# Altium schematic sheet 10_J4_CONN.SchDoc
size 420 x 297 mm; SheetNumber: 10; SheetTotal: 10
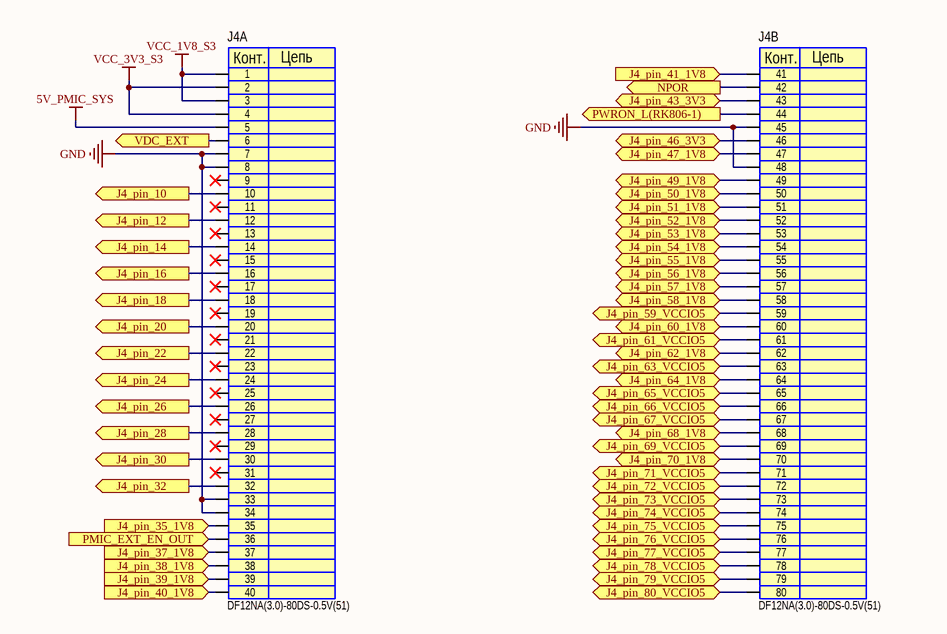
[diagram p0: 10_J4_CONN.SchDoc]

## Parts
J4  DF12NA(3.0)-80DS-0.5V(51)  [CONN_DF12NA3.0-80DS-0.5V51_HIR]  (parts A,B of 2)

## Ports
J4_pin_10 (out), J4_pin_12 (out), J4_pin_14 (out), J4_pin_16 (out), J4_pin_18 (out), J4_pin_20 (out), J4_pin_22 (out), J4_pin_24 (out), J4_pin_26 (out), J4_pin_28 (out), J4_pin_30 (out), J4_pin_32 (out), J4_pin_35_1V8 (in), J4_pin_37_1V8 (in), J4_pin_38_1V8 (in), J4_pin_39_1V8 (in), J4_pin_40_1V8 (in), J4_pin_41_1V8 (in), J4_pin_43_3V3 (bidir), J4_pin_46_3V3 (bidir), J4_pin_47_1V8 (bidir), J4_pin_49_1V8 (bidir), J4_pin_50_1V8 (bidir), J4_pin_51_1V8 (bidir), J4_pin_52_1V8 (bidir), J4_pin_53_1V8 (bidir), J4_pin_54_1V8 (bidir), J4_pin_55_1V8 (bidir), J4_pin_56_1V8 (bidir), J4_pin_57_1V8 (bidir), J4_pin_58_1V8 (bidir), J4_pin_59_VCCIO5 (bidir), J4_pin_60_1V8 (bidir), J4_pin_61_VCCIO5 (bidir), J4_pin_62_1V8 (bidir), J4_pin_63_VCCIO5 (bidir), J4_pin_64_1V8 (bidir), J4_pin_65_VCCIO5 (bidir), J4_pin_66_VCCIO5 (bidir), J4_pin_67_VCCIO5 (bidir), J4_pin_68_1V8 (bidir), J4_pin_69_VCCIO5 (bidir), J4_pin_70_1V8 (bidir), J4_pin_71_VCCIO5 (bidir), J4_pin_72_VCCIO5 (bidir), J4_pin_73_VCCIO5 (bidir), J4_pin_74_VCCIO5 (bidir), J4_pin_75_VCCIO5 (bidir), J4_pin_76_VCCIO5 (bidir), J4_pin_77_VCCIO5 (bidir), J4_pin_78_VCCIO5 (bidir), J4_pin_79_VCCIO5 (bidir), J4_pin_80_VCCIO5 (bidir), NPOR (out), PMIC_EXT_EN_OUT (in), PWRON_L(RK806-1) (out), VDC_EXT (out)

## Nets
5V_PMIC_SYS: J4.5
GND: J4.7 J4.8 J4.33 J4.34 J4.45 J4.48
VCC_1V8_S3: J4.1 J4.3
VCC_3V3_S3: J4.2 J4.4
J4_pin_10: J4.10 ; port J4_pin_10
J4_pin_12: J4.12 ; port J4_pin_12
J4_pin_14: J4.14 ; port J4_pin_14
J4_pin_16: J4.16 ; port J4_pin_16
J4_pin_18: J4.18 ; port J4_pin_18
J4_pin_20: J4.20 ; port J4_pin_20
J4_pin_22: J4.22 ; port J4_pin_22
J4_pin_24: J4.24 ; port J4_pin_24
J4_pin_26: J4.26 ; port J4_pin_26
J4_pin_28: J4.28 ; port J4_pin_28
J4_pin_30: J4.30 ; port J4_pin_30
J4_pin_32: J4.32 ; port J4_pin_32
J4_pin_35_1V8: J4.35 ; port J4_pin_35_1V8
J4_pin_37_1V8: J4.37 ; port J4_pin_37_1V8
J4_pin_38_1V8: J4.38 ; port J4_pin_38_1V8
J4_pin_39_1V8: J4.39 ; port J4_pin_39_1V8
J4_pin_40_1V8: J4.40 ; port J4_pin_40_1V8
J4_pin_41_1V8: J4.41 ; port J4_pin_41_1V8
J4_pin_43_3V3: J4.43 ; port J4_pin_43_3V3
J4_pin_46_3V3: J4.46 ; port J4_pin_46_3V3
J4_pin_47_1V8: J4.47 ; port J4_pin_47_1V8
J4_pin_49_1V8: J4.49 ; port J4_pin_49_1V8
J4_pin_50_1V8: J4.50 ; port J4_pin_50_1V8
J4_pin_51_1V8: J4.51 ; port J4_pin_51_1V8
J4_pin_52_1V8: J4.52 ; port J4_pin_52_1V8
J4_pin_53_1V8: J4.53 ; port J4_pin_53_1V8
J4_pin_54_1V8: J4.54 ; port J4_pin_54_1V8
J4_pin_55_1V8: J4.55 ; port J4_pin_55_1V8
J4_pin_56_1V8: J4.56 ; port J4_pin_56_1V8
J4_pin_57_1V8: J4.57 ; port J4_pin_57_1V8
J4_pin_58_1V8: J4.58 ; port J4_pin_58_1V8
J4_pin_59_VCCIO5: J4.59 ; port J4_pin_59_VCCIO5
J4_pin_60_1V8: J4.60 ; port J4_pin_60_1V8
J4_pin_61_VCCIO5: J4.61 ; port J4_pin_61_VCCIO5
J4_pin_62_1V8: J4.62 ; port J4_pin_62_1V8
J4_pin_63_VCCIO5: J4.63 ; port J4_pin_63_VCCIO5
J4_pin_64_1V8: J4.64 ; port J4_pin_64_1V8
J4_pin_65_VCCIO5: J4.65 ; port J4_pin_65_VCCIO5
J4_pin_66_VCCIO5: J4.66 ; port J4_pin_66_VCCIO5
J4_pin_67_VCCIO5: J4.67 ; port J4_pin_67_VCCIO5
J4_pin_68_1V8: J4.68 ; port J4_pin_68_1V8
J4_pin_69_VCCIO5: J4.69 ; port J4_pin_69_VCCIO5
J4_pin_70_1V8: J4.70 ; port J4_pin_70_1V8
J4_pin_71_VCCIO5: J4.71 ; port J4_pin_71_VCCIO5
J4_pin_72_VCCIO5: J4.72 ; port J4_pin_72_VCCIO5
J4_pin_73_VCCIO5: J4.73 ; port J4_pin_73_VCCIO5
J4_pin_74_VCCIO5: J4.74 ; port J4_pin_74_VCCIO5
J4_pin_75_VCCIO5: J4.75 ; port J4_pin_75_VCCIO5
J4_pin_76_VCCIO5: J4.76 ; port J4_pin_76_VCCIO5
J4_pin_77_VCCIO5: J4.77 ; port J4_pin_77_VCCIO5
J4_pin_78_VCCIO5: J4.78 ; port J4_pin_78_VCCIO5
J4_pin_79_VCCIO5: J4.79 ; port J4_pin_79_VCCIO5
J4_pin_80_VCCIO5: J4.80 ; port J4_pin_80_VCCIO5
NPOR: J4.42 ; port NPOR
PMIC_EXT_EN_OUT: J4.36 ; port PMIC_EXT_EN_OUT
PWRON_L(RK806-1): J4.44 ; port PWRON_L(RK806-1)
VDC_EXT: J4.6 ; port VDC_EXT

Not connected (* = marked no-connect by the designer): J4 9* 11* 13* 15* 17* 19* 21* 23* 25* 27* 29* 31*

## Notes on the sheet
- THIS DOCUMENT AND THE DATA DISCLOSED HEREIN OR
- HEREWITH IS THE PROPERTY OF ALTIUM LIMITED AND MAY
- DWG NO:
- REVISION
- REV:
- DESCRIPTION
- DATE
- APPROVED
- BE FREELY DISTRIBUTED IN WHOLE. NO RIGHTS ARE
- RESERVED OR EXPRESS OR IMPLIED WARANTEE GIVEN.
- ENG:
- APPROVALS
- PROJECT
- DSN:
- CHK:
- REFERENCE DOCUMENTS
- PROJECT REVISION:
- TITLE
- DOCUMENT REVISION:
- DESIGN ITEM:
- BOM:
- FAB DWG:
- PCB DWG:
- ASSY DWG:
- SCALE:
- A3
- SIZE
- CAGE CODE
- FILE NAME
- DWG NO.
- SHEET
- OF
- REV
- (in symbol DF12NA(3.0)-80DS-0.5V(51), part A) Конт.; Цепь
- (in symbol DF12NA(3.0)-80DS-0.5V(51), part B) Конт.; Цепь

## Library data of the parts
J4 = DF12NA(3.0)-80DS-0.5V(51): 0.5mm Pitch SMT Board-to-Board Connector; Manufacturer: Hirose; Row: 2; Positions: 80; Male/Female: F; ComponentLink1Description: Link; ComponentLink2Description: LocalLink; ComponentLink2URL: C:\Users\Public\Documents\Altium\Datasheet\Connectors\DF12NA(3.0)-80DS-0.5V(51).pdf; Type: Board-to-Board; Temperature: -40...+105°C; PartNumber: DF12NA(3.0)-80DS-0.5V(51)